# Altium schematic sheet MCU_debug(1).SchDoc: =DT_SCH_Title
size A4; Organization: Droid Technologies; SheetNumber: 4; SheetTotal: 16
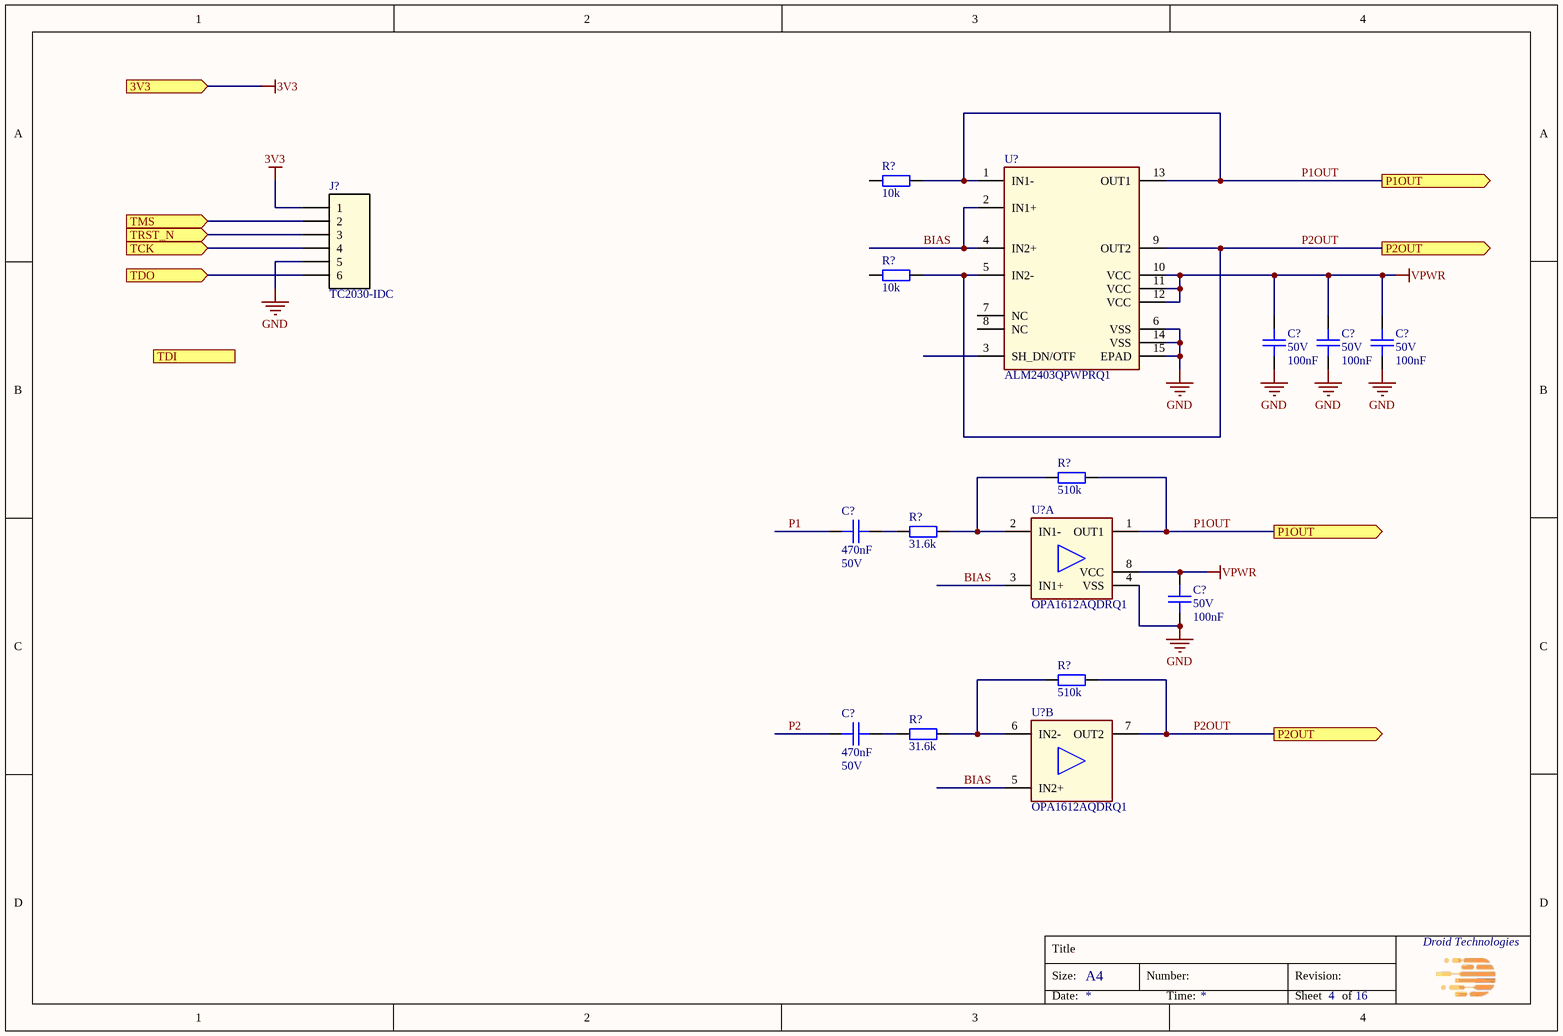
[diagram p0: MCU_debug(1).SchDoc]

## Parts
(Parts that share a designator on the sheet are numbered #1, #2 ... from top to bottom, then left to right.)
C?#1  Voltage Rating: 50V  Capacitance: 100nF  [CAPC100x50x50L25]  (hidden comment: GCM155L8EH104KE07D)
C?#2  Voltage Rating: 50V  Capacitance: 100nF  [CAPC100x50x50L25]  (hidden comment: GCM155L8EH104KE07D)
C?#3  Voltage Rating: 50V  Capacitance: 100nF  [CAPC100x50x50L25]  (hidden comment: GCM155L8EH104KE07D)
C?#4  Capacitance: 470nF  Voltage Rating: 50V  [CAPC200X125X145L50]  (hidden comment: CGA4J1X8L1H474K125AC)
C?#5  Voltage Rating: 50V  Capacitance: 100nF  [CAPC100x50x50L25]  (hidden comment: GCM155L8EH104KE07D)
C?#6  Capacitance: 470nF  Voltage Rating: 50V  [CAPC200X125X145L50]  (hidden comment: CGA4J1X8L1H474K125AC)
J?  TC2030-IDC  [CONN_TC2030-IDC_Light]  (no BOM)
R?#1  Resistance: 10k  [RESC100X50X40L25]  (hidden comment: RC0402FR-0710KL)
R?#2  Resistance: 10k  [RESC100X50X40L25]  (hidden comment: RC0402FR-0710KL)
R?#3  Resistance: 510k  [RESC100X50X40L25]  (hidden comment: RC0402FR-07510KL)
R?#4  Resistance: 31.6k  [RESC100X50X40L25]  (hidden comment: RC0402FR-0731K6L)
R?#5  Resistance: 510k  [RESC100X50X40L25]  (hidden comment: RC0402FR-07510KL)
R?#6  Resistance: 31.6k  [RESC100X50X40L25]  (hidden comment: RC0402FR-0731K6L)
U?#1  ALM2403QPWPRQ1  [14-HTSSOP]
U?#2  OPA1612AQDRQ1  [SOIC8P127_490X600X175L70X41]  (part A of 2)
U?#3  OPA1612AQDRQ1  [SOIC8P127_490X600X175L70X41]  (part B of 2)

## Ports
3V3 (in), P1OUT (out), P2OUT (out), TCK (in), TDI (in), TDO (in), TMS (in), TRST_N (in)

## Nets
3V3: J?.1 ; port 3V3
GND: C?#1.1 C?#2.1 C?#3.1 C?#5.1 J?.5 U?#1.6(VSS) U?#1.14(VSS) U?#1.15(EPAD) U?#2.4(VSS)
VPWR: C?#1.2 C?#2.2 C?#3.2 C?#5.2 U?#1.10(VCC) U?#1.11(VCC) U?#1.12(VCC) U?#2.8(VCC)
BIAS: U?#1.2(IN1+) U?#1.4(IN2+) U?#2.3(IN1+) U?#3.5(IN2+)
P1: C?#4.2
P1OUT: R?#1.1 R?#3.2 U?#1.1(IN1-) U?#1.13(OUT1) U?#2.1(OUT1) ; port P1OUT
P2: C?#6.2
P2OUT: R?#2.1 R?#5.2 U?#1.5(IN2-) U?#1.9(OUT2) U?#3.7(OUT2) ; port P2OUT
TCK: J?.4 ; port TCK
TDO: J?.6 ; port TDO
TMS: J?.2 ; port TMS
TRST_N: J?.3 ; port TRST_N
NetC?#4_1: C?#4.1 R?#4.1
NetC?#6_1: C?#6.1 R?#6.1
NetR?#3_1: R?#3.1 R?#4.2 U?#2.2(IN1-)
NetR?#5_1: R?#5.1 R?#6.2 U?#3.6(IN2-)

Not connected (* = marked no-connect by the designer): R?#1 2; R?#2 2; U?#1 3(SH_DN/OTF) 7(NC) 8(NC)

## Notes on the sheet
- Title
- Size:
- A4
- Number:
- Revision:
- Date:
- Time:
- Sheet
- of

## Library data of the parts
C?#1-C?#3 C?#5 = CMP-001-1980-1: CAP CER 0.1UF 50V X8L 0402; Manufacturer: Murata Electronics; Op Temp max: 150°C; Op Temp min: -55°C; Tolerance: 10%; Height max: 550µm; ComponentLink3Description: Digikey; Mounting Type: SM; ComponentLink3URL: https://www.digikey.com/en/products/detail/murata-electronics/GCM155L8EH104KE07D/11618823; Package: 0402 (1005 Metric); Lead Spacing: 0mm; MPN: GCM155L8EH104KE07D; Size: 1.00mm x 0.50mm; Ratings: AEC-Q200; ComponentLink1URL: https://search.murata.co.jp/Ceramy/image/img/A01X/G101/ENG/GCM155L8EH104KE07-01.pdf; ComponentLink1Description: Datasheet; Dielectric: X8L; ComponentLink2Description: Mouser; ComponentLink2URL: https://eu.mouser.com/ProductDetail/Murata-Electronics/GCM155L8EH104KE07D?qs=1mbolxNpo8fQSHf0HYnZWw%3D%3D
C?#4 C?#6 = CMP-001-2015-1: CAP CER 0.47UF 50V X8L 0805; Manufacturer: TDK Corporation; Op Temp min: -55°C; Tolerance: 10%; Op Temp max: 150°C; ComponentLink1Description: Datasheet; Size: 2.00mm x 1.25mm; Dielectric: X8L; ComponentLink3URL: https://www.digikey.com/en/products/detail/tdk-corporation/CGA4J1X8L1H474K125AC/12807037?s=N4IgjCBcoKxaBjKAzAhgGwM4FMA0IB7KAbRAGYYAWAdgA5KQBdfABwBcoQBlNgJwEsAdgHMQAX3xgG0EEkhoseQiRAAmMrWoamrDpG58hoieABs8WSgw58RSKTIBOMqsc6Q7TjwEjx%2BU24ycgo2yvYglAAMjpRg5sweegY%2BxviqMKoWwdZKdqSqlK5kEGmFztQgpa6xlWpllLTunvreRn7gjrSBiFaKtiqRTCaqkZTdlvI5-eGRAHQ0AAQArQBitTSRC4JrCc0gAKqC-GwA8sgAstiomACuvNjtALSZQVB8N7kqcPhujCaP4zk70%2B4QgfzEYiAA; Ratings: AEC-Q200; ComponentLink3Description: Digikey; ComponentLink2Description: Mouser; Mounting Type: SM; Lead Spacing: 0mm; ComponentLink1URL: https://product.tdk.com/system/files/dam/doc/product/capacitor/ceramic/mlcc/catalog/mlcc_automotive_hightemp_en.pdf; MPN: CGA4J1X8L1H474K125AC; Height max: 1.45mm; ComponentLink2URL: https://eu.mouser.com/ProductDetail/TDK/CGA4J1X8L1H474K125AC?qs=W%2FMpXkg%252BdQ5d8zdfD6mokw%3D%3D; Package: 0805 (2012 Metric)
J? = CONN_TC2030_Light: PLUG-OF-NAILS 6-PIN W/ LEGS 8"; Manufacturer: Tag-Connect LLC; MPN: TC2030; Series: Plug-Of-Nails™; ComponentLink1Description: Datasheet; ComponentLink1URL: https://mm.digikey.com/Volume0/opasdata/d220001/medias/docus/2084/TC2030-IDC_RevB.pdf; ComponentLink2Description: DigiKey; ComponentLink2URL: https://www.digikey.pl/en/products/detail/tag-connect-llc/TC2030-IDC/4571121
R?#1 R?#2 = CMP-00010-6: RES 10K OHM 1% 1/16W 0402; Manufacturer: YAGEO; Op Temp max: 155°C; Op Temp min: -55°C; Power: 63mW; Temperature Coefficient: ±100ppm; ComponentLink3URL: https://www.digikey.com/en/products/detail/yageo/RC0402FR-0710KL/726523; ComponentLink1Description: Datasheet; Height max: 400µm; ComponentLink3Description: Digikey; ComponentLink2URL: https://www2.mouser.com/ProductDetail/YAGEO/RC0402FR-0710KL?qs=%2Fha2pyFaduhjtLcYvKXQ8NAGbRXkQ%2Fwl6RsvWHeV66MSeqLhkcF3rg%3D%3D; Ratings: -; MPN: RC0402FR-0710KL; ComponentLink1URL: https://www.yageo.com/upload/media/product/productsearch/datasheet/rchip/PYu-RC_Group_51_RoHS_L_12.pdf; ComponentLink2Description: Mouser; Mounting Type: SM; Tolerance: 1%; Composition: Thick Film; Size: 1.00mm x 0.50mm; Package: 0402 (1005 Metric)
R?#3 R?#5 = CMP-001-0533-6: RES 510K OHM 1% 1/16W 0402; Manufacturer: YAGEO; Op Temp max: 155°C; Temperature Coefficient: ±100ppm; Op Temp min: -55°C; Power: 63mW; Package: 0402 (1005 Metric); Composition: Thick Film; Size: 1.00mm x 0.50mm; ComponentLink2Description: Mouser; MPN: RC0402FR-07510KL; Height max: 400µm; ComponentLink1URL: https://www.yageo.com/upload/media/product/productsearch/datasheet/rchip/PYu-RC_Group_51_RoHS_L_12.pdf; ComponentLink2URL: https://eu.mouser.com/ProductDetail/YAGEO/RC0402FR-07510KL?qs=V1yeUXFNrkkq0IeA5n8CcA%3D%3D; Tolerance: 1%; Mounting Type: SM; ComponentLink3Description: Digikey; ComponentLink3URL: https://www.digikey.com/en/products/detail/yageo/RC0402FR-07510KL/726631; Ratings: -; ComponentLink1Description: Datasheet
R?#4 R?#6 = CMP-00475-6: RES 31.6K OHM 1% 1/16W 0402; Manufacturer: YAGEO; Power: 63mW; Temperature Coefficient: ±100ppm; Op Temp max: 155°C; Op Temp min: -55°C; ComponentLink2Description: Mouser; Size: 1.00mm x 0.50mm; ComponentLink3URL: https://www.digikey.com/en/products/detail/yageo/RC0402FR-0731K6L/5280975; Composition: Thick Film; Mounting Type: SM; ComponentLink1URL: https://www.yageo.com/upload/media/product/productsearch/datasheet/rchip/PYu-RC_Group_51_RoHS_L_12.pdf; Tolerance: 1%; ComponentLink3Description: Digikey; MPN: RC0402FR-0731K6L; ComponentLink1Description: Datasheet; Ratings: -; ComponentLink2URL: https://eu.mouser.com/ProductDetail/YAGEO/RC0402FR-0731K6L?qs=tQYgeJ5sXdm2wsAqEjplmg%3D%3D; Package: 0402 (1005 Metric); Height max: 400µm
U?#1 = ALM2403QPWPRQ1: IC OPAMP GP 2 CIRCUIT 14HTSSOP; Manufacturer: Texas Instruments; MPN: ALM2403QPWPRQ1
U?#2 U?#3 = CMP-001-2012-1: IC AUDIO 2 CIRCUIT 8SOIC; Manufacturer: Texas Instruments; Vmax: 36V; Op Temp min: -40°C; Io: 62mA; Output Type: Rail-to-Rail; Vmin: 4.5V; Vos: 100µV; SR: 27V/µs; Op Temp max: 125°C; GBW: 80MHz; Number of Circuits: 2; ComponentLink2Description: Mouser; ComponentLink2URL: https://eu.mouser.com/ProductDetail/Texas-Instruments/OPA1612AQDRQ1?qs=8%2FmU9qzJpL88MwkHDflokw%3D%3D; Mounting Type: SM; Ratings: AEC-Q100; ComponentLink1Description: Datasheet; ComponentLink3Description: Digikey; Package: 8-SOIC (0.154", 3.90mm Width); ComponentLink3URL: https://www.digikey.com/en/products/detail/texas-instruments/OPA1612AQDRQ1/5773903?s=N4IgjCBcoEwKwyqAxlAZgQwDYGcCmANCAPZQDaIMYMALAOwAcIAukQA4AuUIAyhwE4BLAHYBzEAF8iAWkTQQqSAICuhEuRBwQRAJwsJUyhoDyABQCCYAGzV9QA; MPN: OPA1612AQDRQ1; ComponentLink1URL: https://www.ti.com/lit/ds/symlink/opa1612-q1.pdf?HQS=dis-dk-null-digikeymode-dsf-pf-null-wwe&ts=1746955758664&ref_url=https%253A%252F%252Fwww.ti.com%252Fgeneral%252Fdocs%252Fsuppproductinfo.tsp%253FdistId%253D10%2526gotoUrl%253Dhttps%253A%252F%252Fwww.ti.com%252Flit%252Fgpn%252Fopa1612-q1